# EAGLE design pcc_circuit_example (EAGLE 7.7.0)
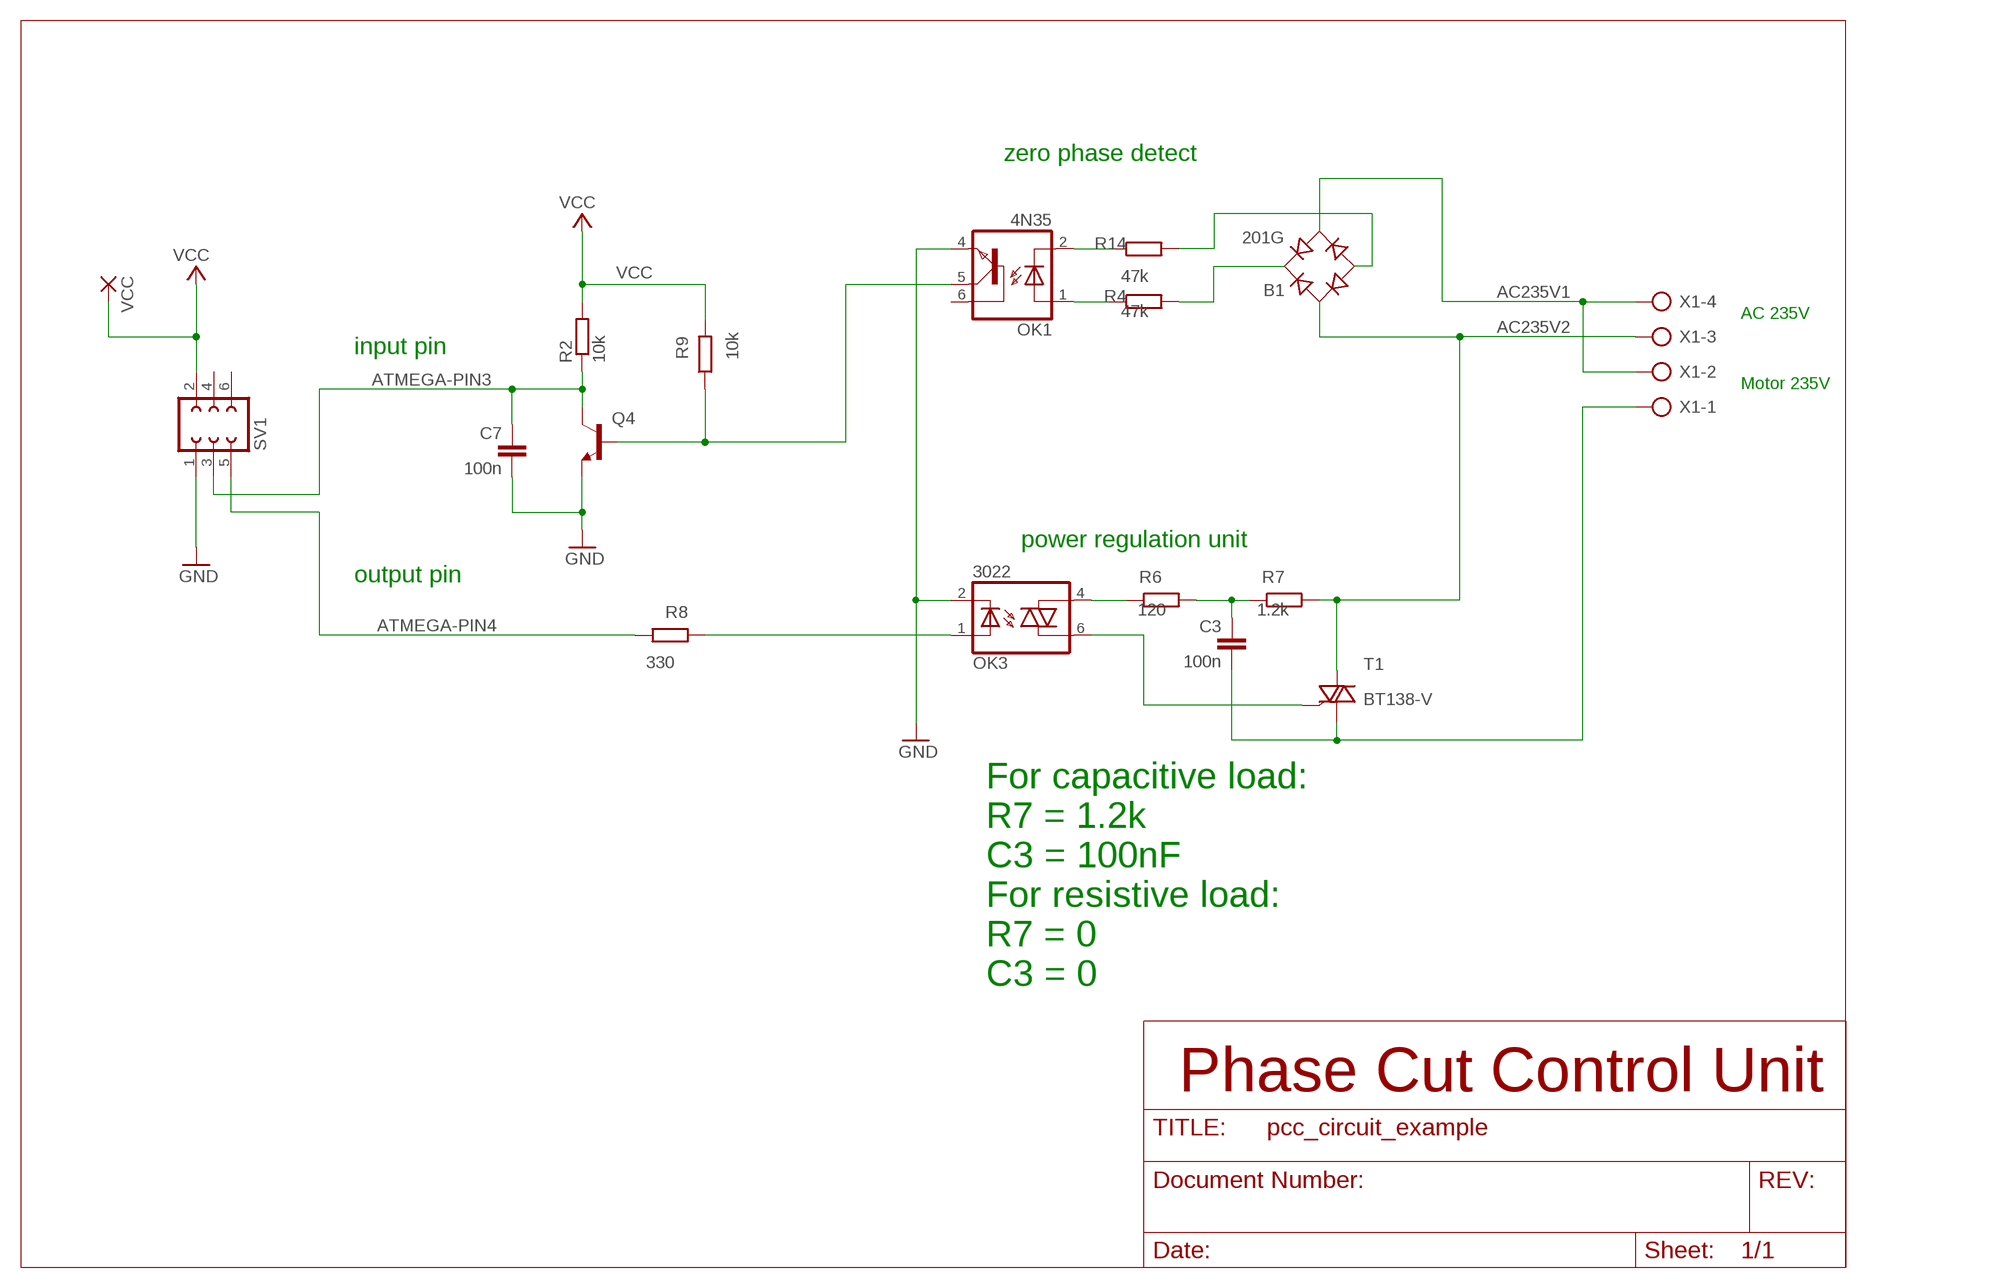
[diagram p0: schematic, sheet 1]

## Parts
B1  201G  RB1A  [RB1A]
C3  100n  C15/5  [C15B5]
C7  100n  C-55MM  [C050-024X044]
OK1  4N35  [DIL06]
OK3  3022  IL420  [DIL06]
Q4  BC548  [TO92-EBC]
R2  10k  R-EU_0207/2V  [R_0207/2V]
R4  47k  R-EU_0207/2V  [R_0207/2V]
R6  120  R-EU_0207/2V  [R_0207/2V]
R7  1.2k  R-EU_0204/7  [R_0204/7]
R8  330  R-EU_0207/2V  [R_0207/2V]
R9  10k  R-EU_0207/2V  [R_0207/2V]
R14  47k  R-EU_0207/2V  [R_0207/2V]
SV1  FE03-2  [FE03-2]
T1  BT138-V  [TO220V]
VCC  PAD1,6/0,8  [PAD1,6/0,8]
X1  AK300/4  [AK300/4]

## Nets
220V_LOAD: C3.2 T1.1(A1) X1.1
AC235V1: B1.AC2 X1.2 X1.4
AC235V2: B1.AC1 R7.2 T1.2(A2) X1.3
ATMEGA-PIN3: C7.1 Q4.C R2.1 SV1.3
ATMEGA-PIN4: R8.2 SV1.5
GND: C7.2 OK1.4(EMI) OK3.2(C) Q4.E SV1.1
N$3: B1.+ R4.2
N$6: B1.- R14.2
N$8: OK3.6(A2) T1.3(G)
N$9: OK1.2(C) R14.1
N$10: OK1.1(A) R4.1
N$11: OK3.1(A) R8.1
N$12: C3.1 R6.2 R7.1
N$14: OK1.5(COL) Q4.B R9.1
N$49: OK3.4(A1) R6.1
VCC: R2.2 R9.2 SV1.2 VCC.1(P)
Unconnected: OK1.6(BAS) SV1.4 SV1.6

## Notes on the sheet
- zero phase detect
- AC 235V
- input pin
- Motor 235V
- power regulation unit
- output pin
- For capacitive load:
  R7 = 1.2k
  C3 = 100nF
  For resistive load: 
  R7 = 0
  C3 = 0
- Phase Cut Control Unit

## Library data of the parts
B1 = rectifier:RB1A: RECTIFIER 1 A
C3 = capacitor-wima:C: CAPACITOR naming: grid - package width
C7 = bauteile_jbt:C-5: standard condensator
OK1 = optocoupler:4N35: MOTOROLA OPTO COUPLER; MF: FAIRCHILD SEMICONDUCTOR; MPN: 4N35; OC_FARNELL: 1328375; OC_NEWARK: 72K9946
OK3 = optocoupler:IL420: SIEMENS OPTO COUPLER; MF: VISHAY/TELEFUNKEN; MPN: IL420; OC_FARNELL: 1469561; OC_NEWARK: 58K1719
Q4 = bauteile_jbt:BC548*: NPN Transistor
R2 R4 R6-R9 R14 = bauteile_jbt:R-EU_: RESISTOR, European symbol
SV1 = bauteile_jbt:FE03-2: FEMALE "Wannenbuchse"
T1 = bauteile_jbt:BT138: TRIAC Source: http://www.semiconductors.philips.com BT138_SERIES_2.pdf
VCC = bauteile_jbt:PAD1,6/0,8: THROUGH-HOLE PAD
X1 = bauteile_jbt:AK300/4: CONNECTOR; OC_FARNELL: unknown; OC_NEWARK: unknown

## Net classes
0 default: width 0.15 mm, drill 0.3 mm, clearance 0.205 mm

## Board
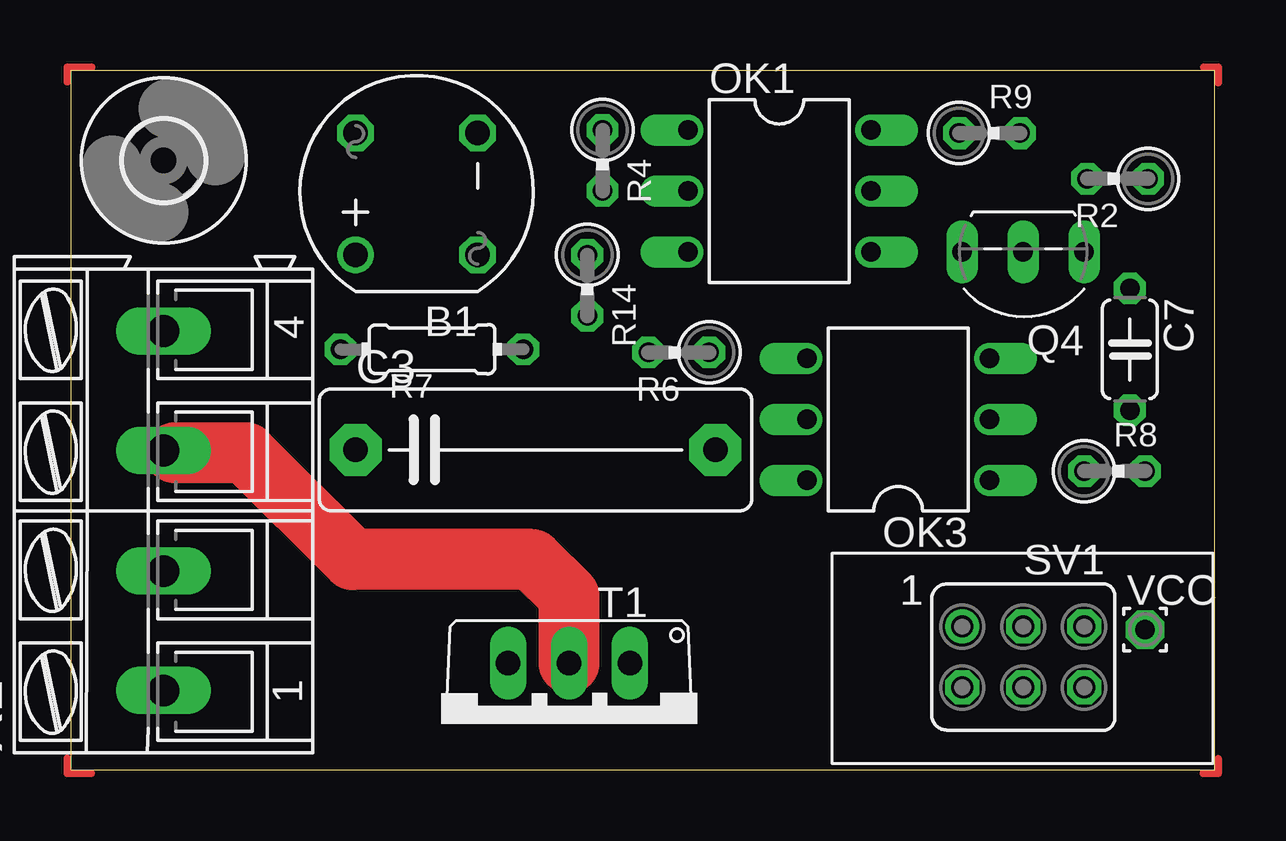
[diagram p1: board, top side]
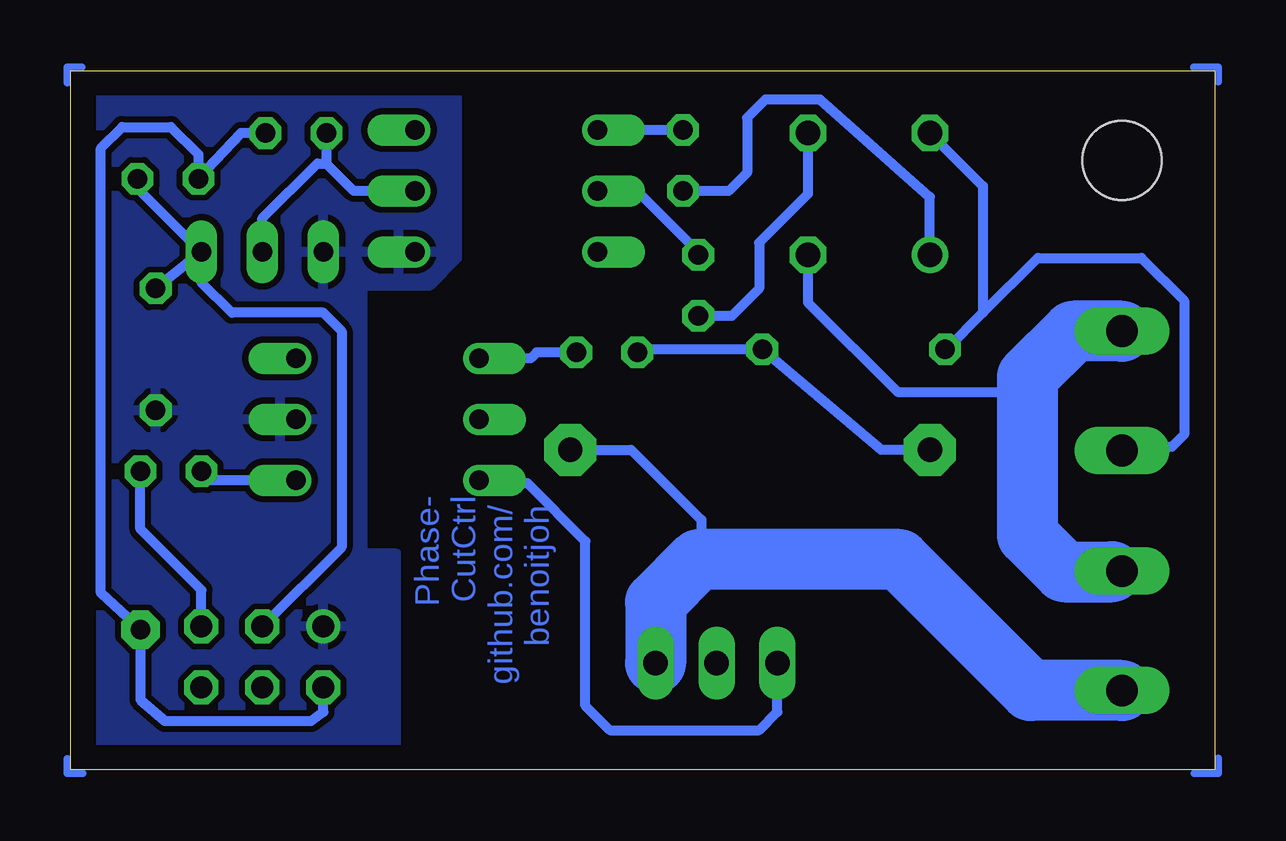
[diagram p2: board, bottom side, seen from below]

Size 47.66 x 29.13 mm. Coordinates in mm from the lower left corner, seen from the top.
Outline: 0,0 47.66,0 47.66,29.13 0,29.13 0,0
Copper layers (1*16): Top 0.035mm / dielectric 1.5mm / Bottom 0.035mm
Design rules "default": minimum track width 10mil, minimum drill 24mil, track to track 8mil, track to pad 8mil, pad to pad 8mil, via to via 8mil, smd to smd 8mil, copper to edge 40mil, drill to drill 8mil, minimum pad ring 10mil, minimum via ring 8mil, stop-mask expansion 4mil, vias tented up to drill 0mil, thermal gap 10mil

### Footprints (pad centres in the part's own frame; a part is rotated, then mirrored left to right if it is on the bottom)
RB1A = drill 1.016: + -2.54,2.54 | drill 1.016 octagon: - 2.54,-2.54; AC1 2.54,2.54; AC2 -2.54,-2.54
C15B5 = drill 1.016 pad 2.159 octagon: 1 -7.493,0; 2 7.493,0
C050-024X044 = drill 0.813 octagon: 1 -2.54,0; 2 2.54,0
DIL06 = drill 0.813 offset: 1 -2.54,-3.81; 2 0,-3.81; 3 2.54,-3.81; 4 2.54,3.81; 5 0,3.81; 6 -2.54,3.81
TO92-EBC = drill 0.813 long: B 0,-1.27; C -2.54,-1.27; E 2.54,-1.27
R_0207/2V = drill 0.813 octagon: 1 -1.27,0; 2 1.27,0
R_0204/7 = drill 0.813 octagon: 1 -3.81,0; 2 3.81,0
FE03-2 = drill 0.914: 1 -2.54,1.27 | drill 0.914 octagon: 2 -2.54,-1.27; 3 0,1.27; 4 0,-1.27; 5 2.54,1.27; 6 2.54,-1.27
TO220V = drill 1.016 long: 1 -2.54,-2.54; 2 0,-2.54; 3 2.54,-2.54
3,3 = hole 3.3: 0,0
PAD1,6/0,8 = drill 0.813 pad 1.6 octagon: 1 0,0
AK300/4 = drill 1.321 long: 1 -7.493,0; 2 -2.515,0; 3 2.515,0; 4 7.493,0

### Placement (x,y rotation side)
B1  14.4,24 90 top
C3  19.35,13.34 0 top
C7  44.12,17.53 270 top
OK1  29.51,24.13 270 top
OK3  34.47,14.61 90 top
Q4  39.67,20.32 180 top
R2  43.61,24.64 180 top
R4  22.15,25.4 270 top
R6  25.32,17.4 180 top
R7  15.04,17.53 180 top
R8  43.48,12.45 0 top
R9  38.28,26.54 0 top
R14  21.51,20.19 270 top
SV1  39.67,4.7 0 top
T1  20.75,1.91 180 top
U$3  [3,3]  3.86,25.4 0 top
VCC  44.75,5.84 0 top
X1  3.86,10.79 90 top

### Tracks (layer width: path | path; a pad name or v marks a point on that pad's centre or on a via)
220V_LOAD
  Bottom 0.406: T1.1 23.29,6.86 | C3.2 24.31,13.34 21.39,10.41 21.39,8.76
  Bottom 2.54: X1.1 7.67,3.3 13.13,8.76 21.39,8.76 21.51,8.76 23.29,6.99 T1.1
AC235V1
  Bottom 0.406: 5.13,19.18 X1.4 | B1.AC2 16.94,19.48 13.21,15.75 8.05,15.75 7.8,15.49
  Bottom 1.524: 4.27,8.26 X1.2
  Bottom 2.54: X1.4 5.89,18.29 7.8,16.38 7.8,15.49 7.8,9.78 6.27,8.26 4.27,8.26
AC235V2
  Top 1.93: 4.34,13.21 X1.3
  Top 2.54: T1.2 20.75,7.24 19.23,8.76 11.73,8.76 7.29,13.21 4.34,13.21
  Bottom 0.406: B1.AC1 9.65,24.33 9.65,19.05 | 9.65,19.05 11.18,17.53 R7.2 | 9.65,19.05 7.37,21.34 3.05,21.34 1.27,19.56 1.27,13.97 1.78,13.46 3.2,13.46 X1.3
ATMEGA-PIN3
  Bottom 0.406: Q4.C C7.1 | Q4.C 42.22,20.32 40.95,19.05 37.13,19.05 36.37,18.29 36.37,9.27 SV1.3 | R2.1 44.76,24.13 Q4.C
ATMEGA-PIN4
  Bottom 0.406: SV1.5 42.22,7.49 44.76,10.03 R8.2
GND
  pour Bottom (isolate 0.254): 32.05,28.32 46.79,28.45 46.79,1.02 34.09,1.02 34.09,9.02 35.48,9.02 35.48,20.19 32.69,20.19 31.55,21.34 31.55,28.32
N$1
  Top 0.305: 47.19,29.29 47.8,29.29 47.8,28.65
N$2
  Bottom 0.305: 47.19,29.29 47.8,29.29 47.8,28.65
N$3
  Bottom 0.406: B1.+ 11.86,23.88 16.43,27.94 18.72,27.94 19.48,27.18 19.48,24.89 20.24,24.13 R4.2
N$4
  Top 0.305: 47.8,0.46 47.8,-0.15 47.17,-0.15
N$5
  Bottom 0.305: 47.8,0.46 47.8,-0.15 47.17,-0.15
N$6
  Bottom 0.406: B1.- 16.94,24 18.97,21.97 18.97,20.07 20.12,18.92 R14.2
N$7
  Top 0.305: 0.84,-0.15 -0.15,-0.15 -0.15,0.48
N$8
  Bottom 0.406: T1.3 18.21,2.41 18.97,1.65 25.2,1.65 26.21,2.67 26.21,9.53 28.63,11.94 30.66,11.94 OK3.6
N$9
  Bottom 0.406: R14.1 21.51,21.59 23.93,24 25.58,24 OK1.2
N$10
  Bottom 0.406: R4.1 OK1.1
N$11
  Bottom 0.406: OK3.1 41.83,12.06 R8.1
N$12
  Bottom 0.406: C3.1 13.89,13.34 R7.1 23.93,17.53 R6.2
N$13
  Bottom 0.305: 0.84,-0.15 -0.15,-0.15 -0.15,0.48
N$14
  Bottom 0.406: OK1.5 35.87,24.13 37.01,25.27 | Q4.B 39.67,22.99 37.39,25.27 37.01,25.27 | R9.1 37.01,25.27
N$49
  Bottom 0.406: R6.1 28.25,17.4 28.5,17.14 OK3.4
N$203
  Top 0.305: -0.15,28.68 -0.15,29.29 0.86,29.29
N$205
  Bottom 0.305: -0.15,28.68 -0.15,29.29 0.86,29.29
VCC
  Bottom 0.406: SV1.2 37.13,2.41 37.64,2.03 43.74,2.03 44.76,2.92 VCC.1 46.41,7.37 46.41,25.91 45.52,26.8 43.48,26.8 42.34,25.65 R2.2 40.56,26.54 R9.2

### Text on the board
Bottom: Phase- / CutCtrl / github.com/ / benoitjoh
tValues: R1 | C1 | HIGH / VOLTAGE
bValues: AC in / L N | for resistive load: / no C1, R1=0 | GND | p0 | pcc | out / L N | VCC